# Altium schematic sheet Main.SchDoc: Maceta_Inteligente
size A4; DrawnBy: Alexis Andres Valencia; Revision: V1R1; SheetNumber: 1; SheetTotal: 4
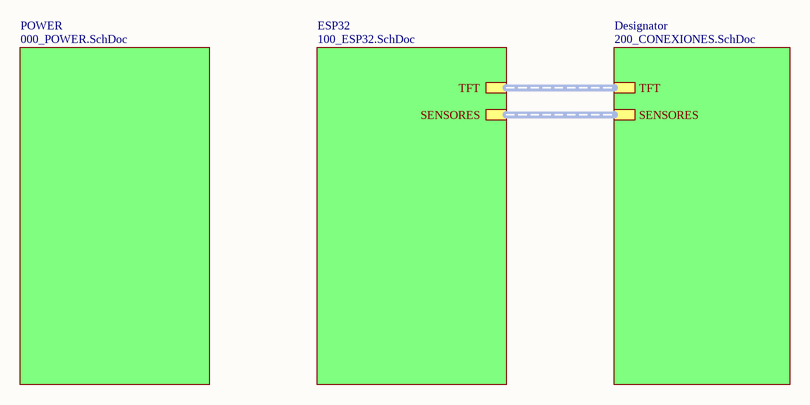
[diagram p0: Main.SchDoc]

## Sub-sheets
Designator = 200_CONEXIONES.SchDoc: TFT (harness TFT_HARNESS), SENSORES (harness SESORES_HARNESS)
ESP32 = 100_ESP32.SchDoc: TFT (harness TFT_HARNESS), SENSORES (harness SESORES_HARNESS)
POWER = 000_POWER.SchDoc: no entries

## Buses and harness runs
harness sheet Designator/SENSORES = sheet ESP32/SENSORES
harness sheet Designator/TFT = sheet ESP32/TFT